# Altium schematic sheet voltage_detector.SchDoc
size A4; SheetNumber: 2; SheetTotal: 5
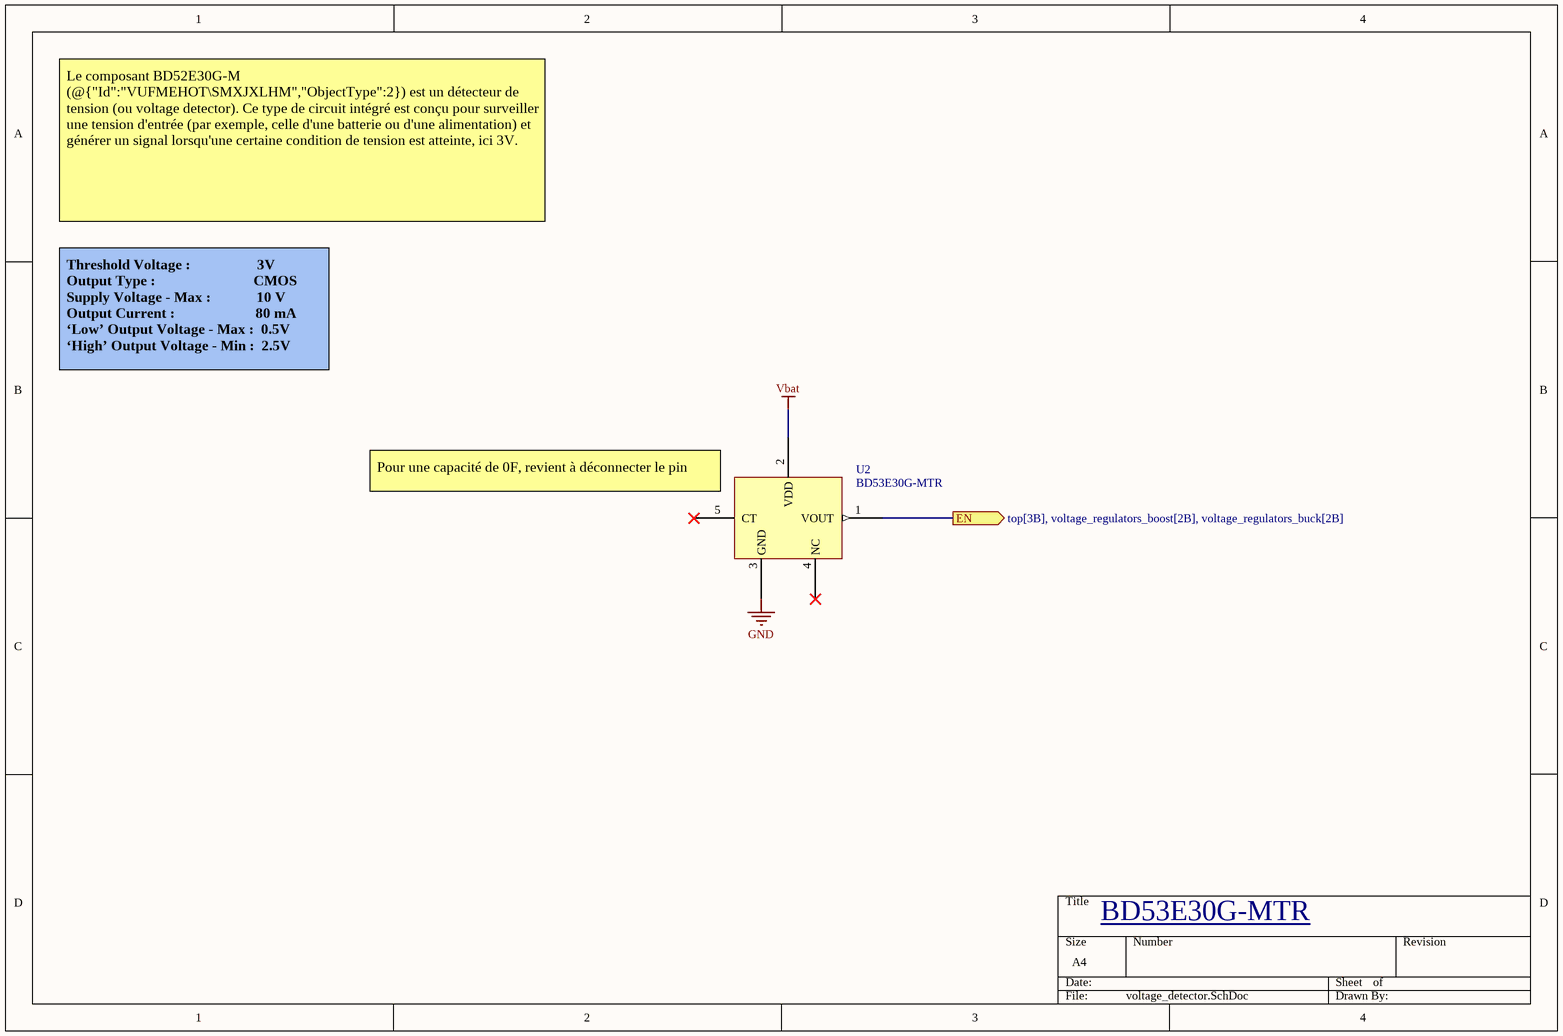
[diagram p0: voltage_detector.SchDoc]

## Parts
U2  BD53E30G-MTR  [BD53E30G-MTR]

## Ports
EN (out, see top[3B], voltage_regulators_boost[2B], voltage_regulators_buck[2B])

## Nets
GND: U2.3(GND)
Vbat: U2.2(VDD)
EN: U2.1(VOUT) ; port EN

Not connected (* = marked no-connect by the designer): U2 4(NC)* 5(CT)*

## Notes on the sheet
- Le composant BD52E30G-M (@{"Id":"VUFMEHOT\SMXJXLHM","ObjectType":2}) est un détecteur de tension (ou voltage detector). Ce type de circuit intégré est conçu pour surveiller une tension d'entrée (par exemple, celle d'une batterie ou d'une alimentation) et générer un signal lorsqu'une certaine condition de tension est atteinte, ici 3V.
- Threshold Voltage :                   3V
  Output Type :                            CMOS
  Supply Voltage - Max :             10 V
  Output Current :                       80 mA
  ‘Low’ Output Voltage - Max :  0.5V
  ‘High’ Output Voltage - Min :  2.5V
- (near U2) Pour une capacité de 0F, revient à déconnecter le pin
- BD53E30G-MTR <https://www.mouser.ch/ProductDetail/ROHM-Semiconductor/BD53E30G-MTR?qs=WHeKGGBt0W8BsyUIHW4eRw%3D%3D>